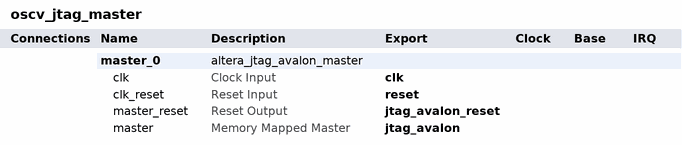
[diagram p0: system contents]
# Platform Designer (Qsys) system oscv_jtag_master, Cyclone V 5CSEMA5F31C6
# Parameters at their usual value, and those the tool derives, are not listed.
package require -exact qsys 25.1
create_system oscv_jtag_master
set_project_property DEVICE_FAMILY {Cyclone V}
set_project_property DEVICE 5CSEMA5F31C6

add_instance master_0 altera_jtag_avalon_master 25.1

# exported interfaces
add_interface clk clock sink
set_interface_property clk EXPORT_OF master_0.clk
add_interface reset reset sink
set_interface_property reset EXPORT_OF master_0.clk_reset
add_interface jtag_avalon avalon master
set_interface_property jtag_avalon EXPORT_OF master_0.master
add_interface jtag_avalon_reset reset source
set_interface_property jtag_avalon_reset EXPORT_OF master_0.master_reset

set_interconnect_requirement {$system} qsys_mm.clockCrossingAdapter HANDSHAKE
set_interconnect_requirement {$system} qsys_mm.maxAdditionalLatency 1

save_system oscv_jtag_master.qsys
